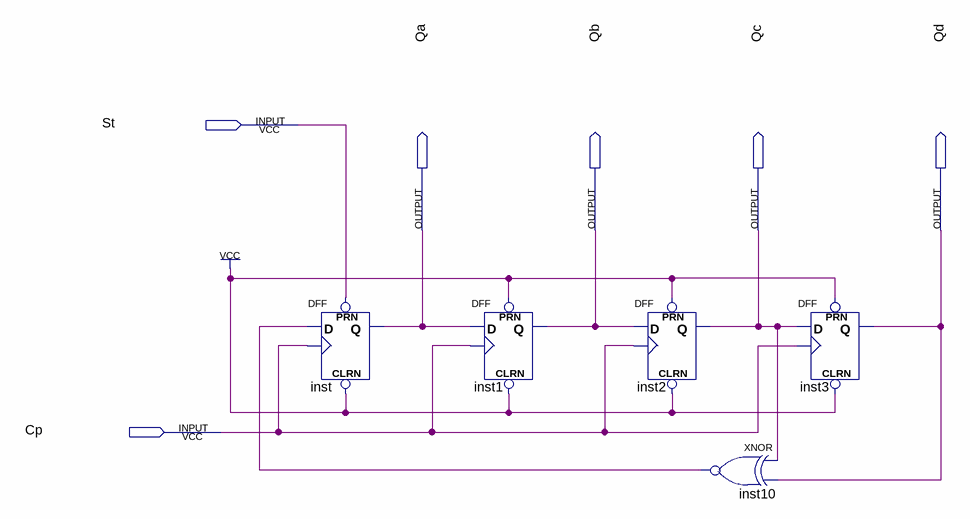
[diagram p0: schematic sheet]
// Quartus schematic RandomlyNum.bdf as structural Verilog: 5 symbols, 6 pins
module RandomlyNum (
  input  St,
  input  Cp,
  output Qa,
  output Qb,
  output Qc,
  output Qd
);

  wire inst10_out;

  DFF inst (.CLRN(1'b1), .CLK(Cp), .D(inst10_out), .PRN(St), .Q(Qa));
  DFF inst1 (.CLRN(1'b1), .CLK(Cp), .D(Qa), .PRN(1'b1), .Q(Qb));
  DFF inst2 (.CLRN(1'b1), .CLK(Cp), .D(Qb), .PRN(1'b1), .Q(Qc));
  xnor inst10 (inst10_out, Qc, Qd);
  DFF inst3 (.CLRN(1'b1), .CLK(Cp), .D(Qc), .PRN(1'b1), .Q(Qd));
endmodule
